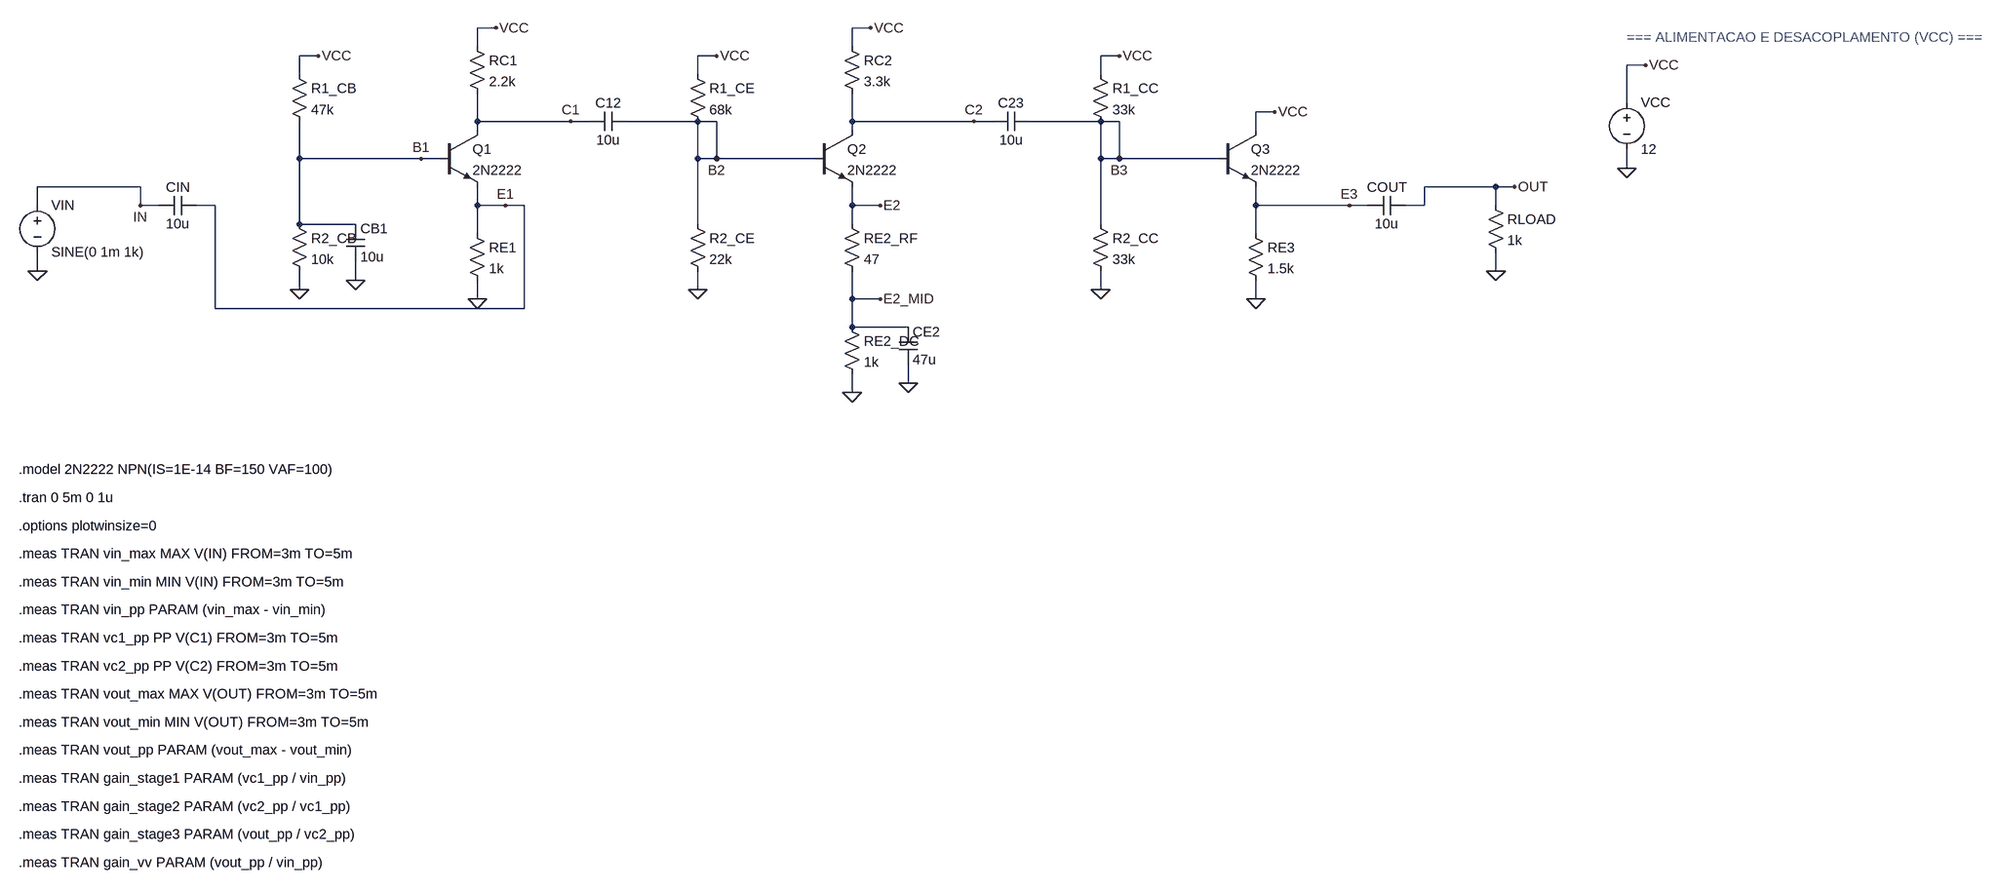
[diagram p0: schematic three_stage_multimode_amplifier.asc]
three_stage_multimode_amplifier.asc, the LTspice schematic file:
Version 4
SHEET 1 4320 1664
WIRE 96 448 96 480
WIRE 304 368 272 368
WIRE 368 368 400 368
WIRE 544 144 544 112
WIRE 544 112 576 112
WIRE 544 224 544 400
WIRE 544 288 576 288
WIRE 544 480 544 512
WIRE 544 400 640 400
WIRE 640 464 640 496
WIRE 784 288 752 288
WIRE 848 96 848 64
WIRE 848 64 880 64
WIRE 848 176 848 240
WIRE 848 224 896 224
WIRE 848 336 848 416
WIRE 848 368 896 368
WIRE 848 496 848 528
WIRE 1040 224 1008 224
WIRE 1104 224 1136 224
WIRE 1280 144 1280 112
WIRE 1280 112 1312 112
WIRE 1280 224 1280 400
WIRE 1280 288 1312 288
WIRE 1280 480 1280 512
WIRE 1488 288 1456 288
WIRE 1552 96 1552 64
WIRE 1552 64 1584 64
WIRE 1552 176 1552 240
WIRE 1552 224 1600 224
WIRE 1552 336 1552 400
WIRE 1552 368 1600 368
WIRE 1552 480 1552 576
WIRE 1552 528 1600 528
WIRE 1552 656 1552 688
WIRE 1552 576 1648 576
WIRE 1648 640 1648 672
WIRE 1792 224 1760 224
WIRE 1856 224 1888 224
WIRE 2032 144 2032 112
WIRE 2032 112 2064 112
WIRE 2032 224 2032 400
WIRE 2032 288 2064 288
WIRE 2032 480 2032 512
WIRE 2240 288 2208 288
WIRE 2304 240 2304 208
WIRE 2304 208 2336 208
WIRE 2304 336 2304 416
WIRE 2304 368 2352 368
WIRE 2304 496 2304 528
WIRE 2496 368 2464 368
WIRE 2560 368 2592 368
WIRE 2736 368 2736 336
WIRE 2736 336 2768 336
WIRE 2736 448 2736 480
WIRE 2960 192 2960 128
WIRE 2960 272 2960 304
WIRE 2960 128 2992 128
WIRE 96 368 96 336
WIRE 96 336 128 336
WIRE 896 224 1008 224
WIRE 2352 368 2464 368
WIRE 1600 224 1760 224
WIRE 128 336 272 336
WIRE 272 336 272 368
WIRE 576 288 752 288
WIRE 2592 368 2592 336
WIRE 2592 336 2768 336
WIRE 1136 224 1312 224
WIRE 1312 224 1312 288
WIRE 1312 288 1456 288
WIRE 1888 224 2064 224
WIRE 2064 224 2064 288
WIRE 2064 288 2208 288
WIRE 400 368 400 544
WIRE 400 544 928 544
WIRE 928 544 928 368
WIRE 928 368 896 368
FLAG 96 480 0
FLAG 272 368 IN
FLAG 576 112 VCC
FLAG 544 512 0
FLAG 640 496 0
FLAG 752 288 B1
FLAG 880 64 VCC
FLAG 896 368 E1
FLAG 848 528 0
FLAG 1008 224 C1
FLAG 1312 112 VCC
FLAG 1312 288 B2
FLAG 1280 512 0
FLAG 1584 64 VCC
FLAG 1600 368 E2
FLAG 1600 528 E2_MID
FLAG 1552 688 0
FLAG 1648 672 0
FLAG 1760 224 C2
FLAG 2064 112 VCC
FLAG 2064 288 B3
FLAG 2032 512 0
FLAG 2336 208 VCC
FLAG 2304 528 0
FLAG 2464 368 E3
FLAG 2768 336 OUT
FLAG 2736 480 0
FLAG 2960 304 0
FLAG 2992 128 VCC
SYMBOL voltage 96 352 R0
WINDOW 3 24 96 Left 2
SYMATTR InstName VIN
SYMATTR Value SINE(0 1m 1k)
SYMBOL cap 368 352 R90
WINDOW 0 0 32 VBottom 2
WINDOW 3 32 32 VTop 2
SYMATTR InstName CIN
SYMATTR Value 10u
SYMBOL res 528 128 R0
SYMATTR InstName R1_CB
SYMATTR Value 47k
SYMBOL res 528 384 R0
SYMATTR InstName R2_CB
SYMATTR Value 10k
SYMBOL cap 624 400 R0
SYMATTR InstName CB1
SYMATTR Value 10u
SYMBOL npn 784 240 R0
SYMATTR InstName Q1
SYMATTR Value 2N2222
SYMBOL res 832 80 R0
SYMATTR InstName RC1
SYMATTR Value 2.2k
SYMBOL res 832 400 R0
SYMATTR InstName RE1
SYMATTR Value 1k
SYMBOL cap 1104 208 R90
WINDOW 0 0 32 VBottom 2
WINDOW 3 32 32 VTop 2
SYMATTR InstName C12
SYMATTR Value 10u
SYMBOL res 1264 128 R0
SYMATTR InstName R1_CE
SYMATTR Value 68k
SYMBOL res 1264 384 R0
SYMATTR InstName R2_CE
SYMATTR Value 22k
SYMBOL npn 1488 240 R0
SYMATTR InstName Q2
SYMATTR Value 2N2222
SYMBOL res 1536 80 R0
SYMATTR InstName RC2
SYMATTR Value 3.3k
SYMBOL res 1536 384 R0
SYMATTR InstName RE2_RF
SYMATTR Value 47
SYMBOL res 1536 560 R0
SYMATTR InstName RE2_DC
SYMATTR Value 1k
SYMBOL cap 1632 576 R0
SYMATTR InstName CE2
SYMATTR Value 47u
SYMBOL cap 1856 208 R90
WINDOW 0 0 32 VBottom 2
WINDOW 3 32 32 VTop 2
SYMATTR InstName C23
SYMATTR Value 10u
SYMBOL res 2016 128 R0
SYMATTR InstName R1_CC
SYMATTR Value 33k
SYMBOL res 2016 384 R0
SYMATTR InstName R2_CC
SYMATTR Value 33k
SYMBOL npn 2240 240 R0
SYMATTR InstName Q3
SYMATTR Value 2N2222
SYMBOL res 2288 400 R0
SYMATTR InstName RE3
SYMATTR Value 1.5k
SYMBOL cap 2560 352 R90
WINDOW 0 0 32 VBottom 2
WINDOW 3 32 32 VTop 2
SYMATTR InstName COUT
SYMATTR Value 10u
SYMBOL res 2720 352 R0
SYMATTR InstName RLOAD
SYMATTR Value 1k
SYMBOL voltage 2960 176 R0
WINDOW 3 24 96 Left 2
SYMATTR InstName VCC
SYMATTR Value 12
TEXT 2960 80 Left 2 ;=== ALIMENTACAO E DESACOPLAMENTO (VCC) ===
TEXT 64 848 Left 2 !.model 2N2222 NPN(IS=1E-14 BF=150 VAF=100)
TEXT 64 896 Left 2 !.tran 0 5m 0 1u
TEXT 64 944 Left 2 !.options plotwinsize=0
TEXT 64 992 Left 2 !.meas TRAN vin_max MAX V(IN) FROM=3m TO=5m
TEXT 64 1040 Left 2 !.meas TRAN vin_min MIN V(IN) FROM=3m TO=5m
TEXT 64 1088 Left 2 !.meas TRAN vin_pp PARAM (vin_max - vin_min)
TEXT 64 1136 Left 2 !.meas TRAN vc1_pp PP V(C1) FROM=3m TO=5m
TEXT 64 1184 Left 2 !.meas TRAN vc2_pp PP V(C2) FROM=3m TO=5m
TEXT 64 1232 Left 2 !.meas TRAN vout_max MAX V(OUT) FROM=3m TO=5m
TEXT 64 1280 Left 2 !.meas TRAN vout_min MIN V(OUT) FROM=3m TO=5m
TEXT 64 1328 Left 2 !.meas TRAN vout_pp PARAM (vout_max - vout_min)
TEXT 64 1376 Left 2 !.meas TRAN gain_stage1 PARAM (vc1_pp / vin_pp)
TEXT 64 1424 Left 2 !.meas TRAN gain_stage2 PARAM (vc2_pp / vc1_pp)
TEXT 64 1472 Left 2 !.meas TRAN gain_stage3 PARAM (vout_pp / vc2_pp)
TEXT 64 1520 Left 2 !.meas TRAN gain_vv PARAM (vout_pp / vin_pp)

The netlist it stands for:
* three_stage_multimode_amplifier.asc
VIN IN 0 SINE(0 1m 1k)
CIN E1 IN 10u
R1_CB VCC B1 47k
R2_CB B1 0 10k
CB1 B1 0 10u
Q1 C1 B1 E1 0 2N2222
RC1 VCC C1 2.2k
RE1 E1 0 1k
C12 B2 C1 10u
R1_CE VCC B2 68k
R2_CE B2 0 22k
Q2 C2 B2 E2 0 2N2222
RC2 VCC C2 3.3k
RE2_RF E2 E2_MID 47
RE2_DC E2_MID 0 1k
CE2 E2_MID 0 47u
C23 B3 C2 10u
R1_CC VCC B3 33k
R2_CC B3 0 33k
Q3 VCC B3 E3 0 2N2222
RE3 E3 0 1.5k
COUT OUT E3 10u
RLOAD OUT 0 1k
VCC VCC 0 12
.model NPN NPN
.model PNP PNP
.lib standard.bjt
* === ALIMENTACAO E DESACOPLAMENTO (VCC) ===
.model 2N2222 NPN(IS=1E-14 BF=150 VAF=100)
.tran 0 5m 0 1u
.options plotwinsize=0
.meas TRAN vin_max MAX V(IN) FROM=3m TO=5m
.meas TRAN vin_min MIN V(IN) FROM=3m TO=5m
.meas TRAN vin_pp PARAM (vin_max - vin_min)
.meas TRAN vc1_pp PP V(C1) FROM=3m TO=5m
.meas TRAN vc2_pp PP V(C2) FROM=3m TO=5m
.meas TRAN vout_max MAX V(OUT) FROM=3m TO=5m
.meas TRAN vout_min MIN V(OUT) FROM=3m TO=5m
.meas TRAN vout_pp PARAM (vout_max - vout_min)
.meas TRAN gain_stage1 PARAM (vc1_pp / vin_pp)
.meas TRAN gain_stage2 PARAM (vc2_pp / vc1_pp)
.meas TRAN gain_stage3 PARAM (vout_pp / vc2_pp)
.meas TRAN gain_vv PARAM (vout_pp / vin_pp)
.backanno
.end